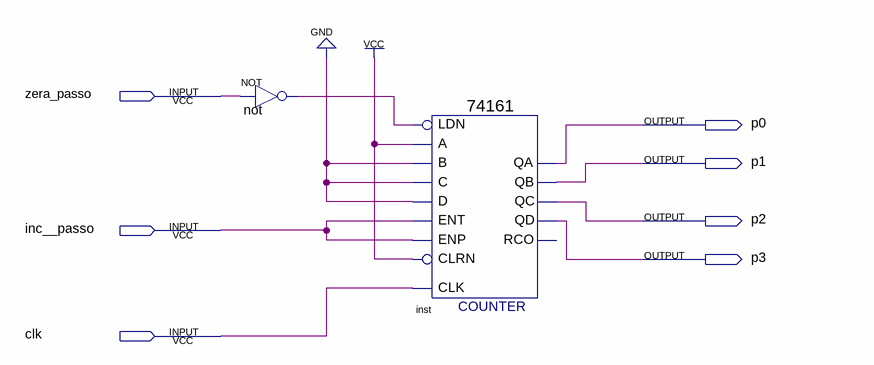
[diagram p0: schematic sheet]
// Quartus schematic passo.bdf as structural Verilog: 2 symbols, 7 pins
module passo (
  input  zera_passo,
  input  inc__passo,
  input  clk,
  output p0,
  output p1,
  output p2,
  output p3
);

  wire not_out;

  not \not  (not_out, zera_passo);
  \74161  inst (
    .CLRN(1'b1), .CLK(clk), .ENP(inc__passo), .LDN(not_out), .A(1'b1), .D(1'b0), .ENT(inc__passo), .B(1'b0),
    .C(1'b0), .QD(p3), .QC(p2), .QB(p1), .QA(p0));  // open: RCO
endmodule
